# Altium schematic sheet OpAmp_Sheet.SchDoc: =Projectname
size A4; DocumentNumber: 1; SheetNumber: 1; SheetTotal: 1
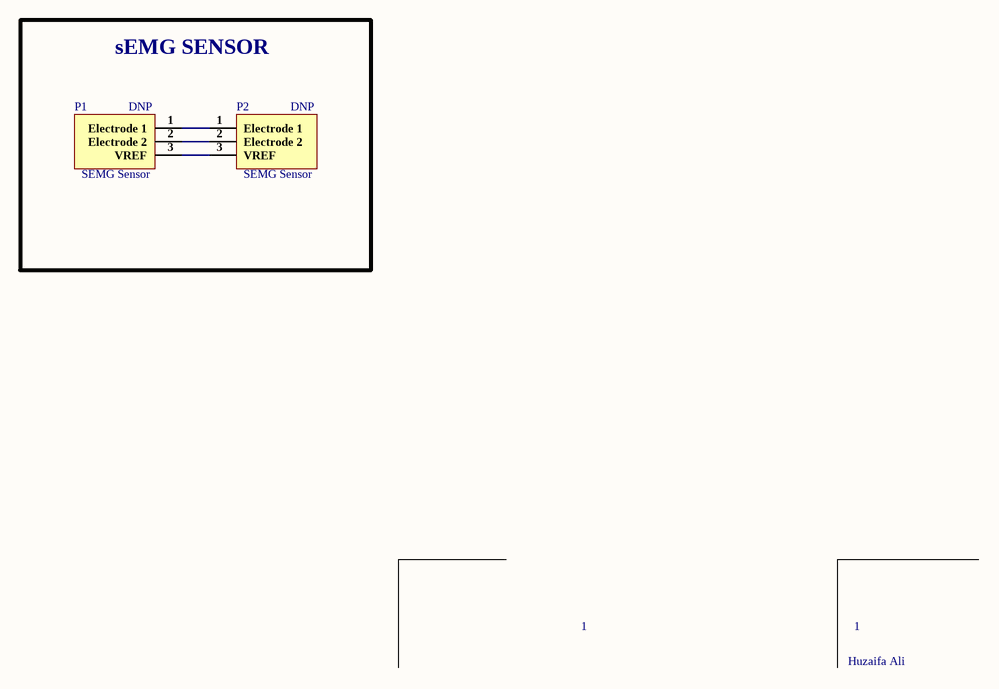
[diagram p0: OpAmp_Sheet.SchDoc]

## Parts
P1  DNP  [sEMG-sensor]
P2  DNP  [sEMG-sensor]

## Blocks framed on the sheet
sEMG SENSOR: P1 P2

## Nets
NetP1_1: P1.1(Electrode_1) P2.1(Electrode_1)
NetP1_2: P1.2(Electrode_2) P2.2(Electrode_2)
NetP1_3: P1.3(VREF) P2.3(VREF)

## Notes on the sheet
- (near P1) SEMG Sensor
- (near P2) SEMG Sensor
- 1
- Huzaifa Ali

## Library data of the parts
P1 P2 = SEMG Sensor: Sensor Connecting Pads